# EasyEDA schematic SCH_Christmas-tree-copy_2026-10-15.json
TITLE: Sheet_1; REV: 1.0; Date: 2026-10-11; Sheet: 1/1; Drawn By: masterskaia; Company: Your Company
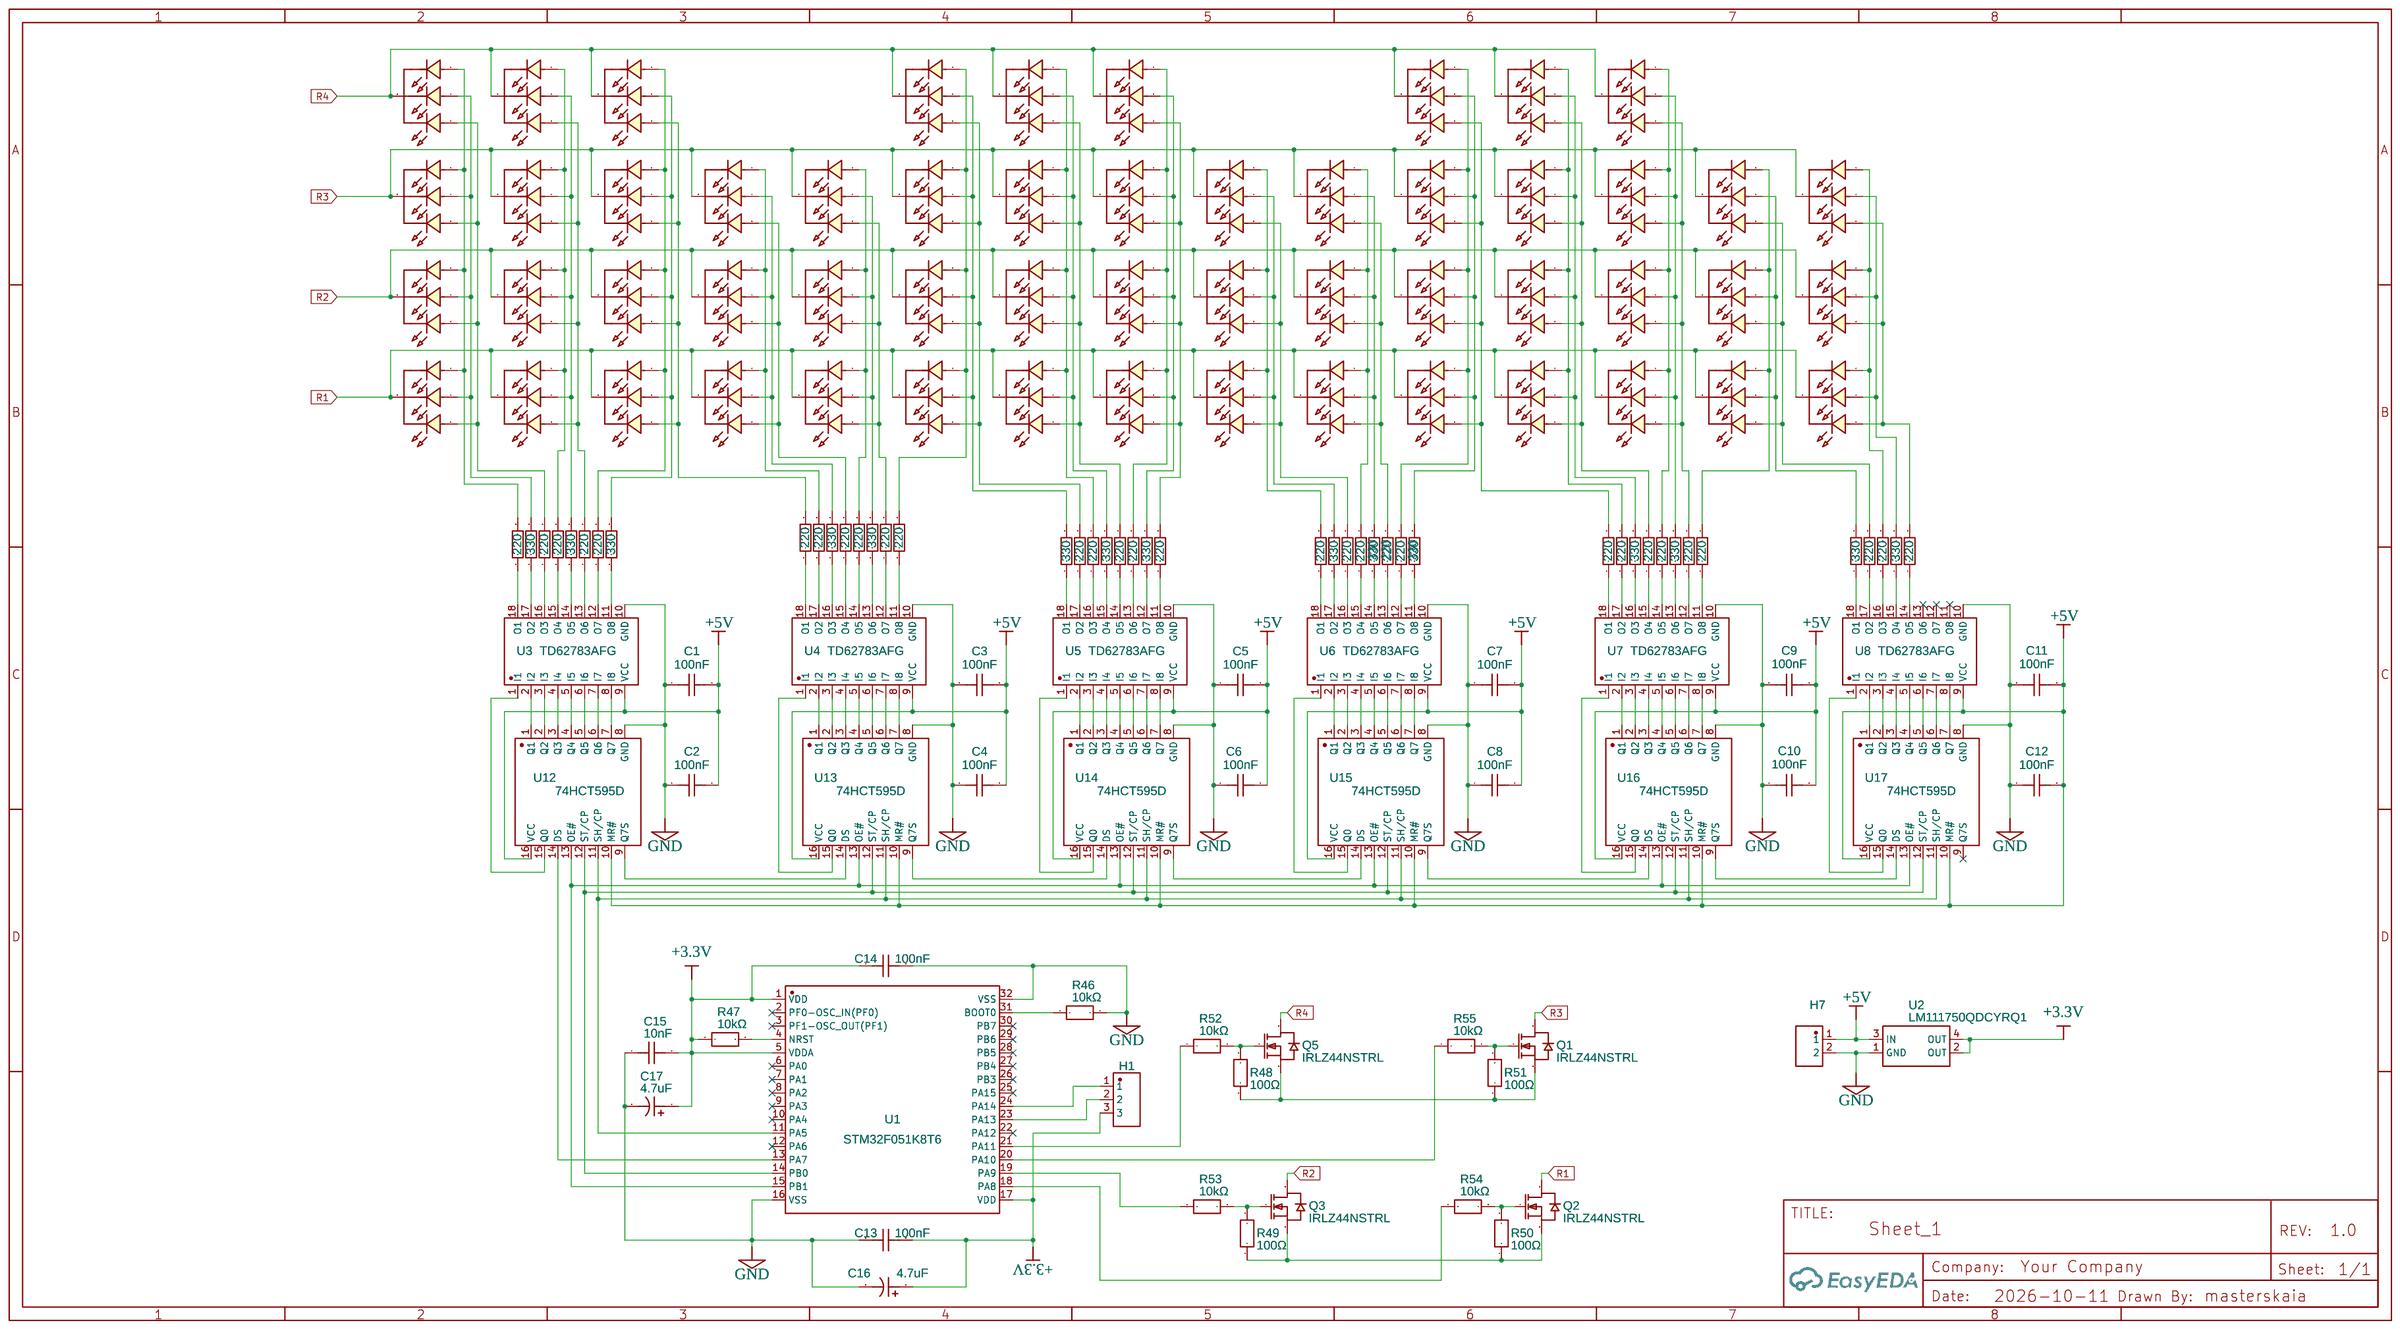
[diagram p0: schematic sheet]

## Parts
C1  100nF  [C0603]
C2  100nF  [C0603]
C3  100nF  [C0603]
C4  100nF  [C0603]
C5  100nF  [C0603]
C6  100nF  [C0603]
C7  100nF  [C0603]
C8  100nF  [C0603]
C9  100nF  [C0603]
C10  100nF  [C0603]
C11  100nF  [C0603]
C12  100nF  [C0603]
C13  100nF  [C0603]
C14  100nF  [C0603]
C15  10nF  [C0603]
C16  4.7uF  [CAP-SMD_L3.2-W1.6]
C17  4.7uF  [CAP-SMD_L3.2-W1.6]
H1  HDGCPH-PZ01-03  [HDR-TH_3P-P2.54-V-M-1]
H7  5AML4-11560-102-W0  [HDR-TH_2P-P2.54-V-M-1]
LED1  R50RGB-4-0045  [LED-TH_4P-L7.6-W7.6-P5.10_R50RGB-4-0045]
LED2  R50RGB-4-0045  [LED-TH_4P-L7.6-W7.6-P5.10_R50RGB-4-0045]
LED3  R50RGB-4-0045  [LED-TH_4P-L7.6-W7.6-P5.10_R50RGB-4-0045]
LED4  R50RGB-4-0045  [LED-TH_4P-L7.6-W7.6-P5.10_R50RGB-4-0045]
LED5  R50RGB-4-0045  [LED-TH_4P-L7.6-W7.6-P5.10_R50RGB-4-0045]
LED6  R50RGB-4-0045  [LED-TH_4P-L7.6-W7.6-P5.10_R50RGB-4-0045]
LED7  R50RGB-4-0045  [LED-TH_4P-L7.6-W7.6-P5.10_R50RGB-4-0045]
LED8  R50RGB-4-0045  [LED-TH_4P-L7.6-W7.6-P5.10_R50RGB-4-0045]
LED9  R50RGB-4-0045  [LED-TH_4P-L7.6-W7.6-P5.10_R50RGB-4-0045]
LED10  R50RGB-4-0045  [LED-TH_4P-L7.6-W7.6-P5.10_R50RGB-4-0045]
LED11  R50RGB-4-0045  [LED-TH_4P-L7.6-W7.6-P5.10_R50RGB-4-0045]
LED12  R50RGB-4-0045  [LED-TH_4P-L7.6-W7.6-P5.10_R50RGB-4-0045]
LED13  R50RGB-4-0045  [LED-TH_4P-L7.6-W7.6-P5.10_R50RGB-4-0045]
LED14  R50RGB-4-0045  [LED-TH_4P-L7.6-W7.6-P5.10_R50RGB-4-0045]
LED15  R50RGB-4-0045  [LED-TH_4P-L7.6-W7.6-P5.10_R50RGB-4-0045]
LED16  R50RGB-4-0045  [LED-TH_4P-L7.6-W7.6-P5.10_R50RGB-4-0045]
LED17  R50RGB-4-0045  [LED-TH_4P-L7.6-W7.6-P5.10_R50RGB-4-0045]
LED18  R50RGB-4-0045  [LED-TH_4P-L7.6-W7.6-P5.10_R50RGB-4-0045]
LED19  R50RGB-4-0045  [LED-TH_4P-L7.6-W7.6-P5.10_R50RGB-4-0045]
LED20  R50RGB-4-0045  [LED-TH_4P-L7.6-W7.6-P5.10_R50RGB-4-0045]
LED21  R50RGB-4-0045  [LED-TH_4P-L7.6-W7.6-P5.10_R50RGB-4-0045]
LED22  R50RGB-4-0045  [LED-TH_4P-L7.6-W7.6-P5.10_R50RGB-4-0045]
LED23  R50RGB-4-0045  [LED-TH_4P-L7.6-W7.6-P5.10_R50RGB-4-0045]
LED24  R50RGB-4-0045  [LED-TH_4P-L7.6-W7.6-P5.10_R50RGB-4-0045]
LED25  R50RGB-4-0045  [LED-TH_4P-L7.6-W7.6-P5.10_R50RGB-4-0045]
LED26  R50RGB-4-0045  [LED-TH_4P-L7.6-W7.6-P5.10_R50RGB-4-0045]
LED27  R50RGB-4-0045  [LED-TH_4P-L7.6-W7.6-P5.10_R50RGB-4-0045]
LED28  R50RGB-4-0045  [LED-TH_4P-L7.6-W7.6-P5.10_R50RGB-4-0045]
LED29  R50RGB-4-0045  [LED-TH_4P-L7.6-W7.6-P5.10_R50RGB-4-0045]
LED30  R50RGB-4-0045  [LED-TH_4P-L7.6-W7.6-P5.10_R50RGB-4-0045]
LED31  R50RGB-4-0045  [LED-TH_4P-L7.6-W7.6-P5.10_R50RGB-4-0045]
LED32  R50RGB-4-0045  [LED-TH_4P-L7.6-W7.6-P5.10_R50RGB-4-0045]
LED33  R50RGB-4-0045  [LED-TH_4P-L7.6-W7.6-P5.10_R50RGB-4-0045]
LED34  R50RGB-4-0045  [LED-TH_4P-L7.6-W7.6-P5.10_R50RGB-4-0045]
LED35  R50RGB-4-0045  [LED-TH_4P-L7.6-W7.6-P5.10_R50RGB-4-0045]
LED36  R50RGB-4-0045  [LED-TH_4P-L7.6-W7.6-P5.10_R50RGB-4-0045]
LED37  R50RGB-4-0045  [LED-TH_4P-L7.6-W7.6-P5.10_R50RGB-4-0045]
LED38  R50RGB-4-0045  [LED-TH_4P-L7.6-W7.6-P5.10_R50RGB-4-0045]
LED39  R50RGB-4-0045  [LED-TH_4P-L7.6-W7.6-P5.10_R50RGB-4-0045]
LED40  R50RGB-4-0045  [LED-TH_4P-L7.6-W7.6-P5.10_R50RGB-4-0045]
LED41  R50RGB-4-0045  [LED-TH_4P-L7.6-W7.6-P5.10_R50RGB-4-0045]
LED42  R50RGB-4-0045  [LED-TH_4P-L7.6-W7.6-P5.10_R50RGB-4-0045]
LED43  R50RGB-4-0045  [LED-TH_4P-L7.6-W7.6-P5.10_R50RGB-4-0045]
LED44  R50RGB-4-0045  [LED-TH_4P-L7.6-W7.6-P5.10_R50RGB-4-0045]
LED45  R50RGB-4-0045  [LED-TH_4P-L7.6-W7.6-P5.10_R50RGB-4-0045]
LED46  R50RGB-4-0045  [LED-TH_4P-L7.6-W7.6-P5.10_R50RGB-4-0045]
LED47  R50RGB-4-0045  [LED-TH_4P-L7.6-W7.6-P5.10_R50RGB-4-0045]
LED48  R50RGB-4-0045  [LED-TH_4P-L7.6-W7.6-P5.10_R50RGB-4-0045]
LED49  R50RGB-4-0045  [LED-TH_4P-L7.6-W7.6-P5.10_R50RGB-4-0045]
LED50  R50RGB-4-0045  [LED-TH_4P-L7.6-W7.6-P5.10_R50RGB-4-0045]
LED51  R50RGB-4-0045  [LED-TH_4P-L7.6-W7.6-P5.10_R50RGB-4-0045]
LED52  R50RGB-4-0045  [LED-TH_4P-L7.6-W7.6-P5.10_R50RGB-4-0045]
LED53  R50RGB-4-0045  [LED-TH_4P-L7.6-W7.6-P5.10_R50RGB-4-0045]
LED54  R50RGB-4-0045  [LED-TH_4P-L7.6-W7.6-P5.10_R50RGB-4-0045]
Q1  IRLZ44NSTRL  [TO-263-2_L10.1-W9.1-P5.08-LS15.2-BR]
Q2  IRLZ44NSTRL  [TO-263-2_L10.1-W9.1-P5.08-LS15.2-BR]
Q3  IRLZ44NSTRL  [TO-263-2_L10.1-W9.1-P5.08-LS15.2-BR]
Q5  IRLZ44NSTRL  [TO-263-2_L10.1-W9.1-P5.08-LS15.2-BR]
R1  330  [R0603]
R2  220  [R0603]
R3  220  [R0603]
R4  220  [R0603]
R5  330  [R0603]
R6  220  [R0603]
R7  220  [R0603]
R8  330  [R0603]
R9  220  [R0603]
R10  220  [R0603]
R11  330  [R0603]
R12  330  [R0603]
R13  220  [R0603]
R14  220  [R0603]
R15  220  [R0603]
R16  220  [R0603]
R17  220  [R0603]
R18  220  [R0603]
R19  330  [R0603]
R20  220  [R0603]
R21  220  [R0603]
R22  330  [R0603]
R23  220  [R0603]
R24  220  [R0603]
R25  330  [R0603]
R26  330  [R0603]
R27  220  [R0603]
R28  220  [R0603]
R29  330  [R0603]
R30  220  [R0603]
R31  220  [R0603]
R32  330  [R0603]
R33  220  [R0603]
R34  220  [R0603]
R35  220  [R0603]
R36  220  [R0603]
R37  330  [R0603]
R38  330  [R0603]
R39  220  [R0603]
R40  220  [R0603]
R41  330  [R0603]
R42  220  [R0603]
R43  220  [R0603]
R44  330  [R0603]
R45  220  [R0603]
R46  10kΩ  [R0603]
R47  10kΩ  [R0603]
R48  100Ω  [R0603]
R49  100Ω  [R0603]
R50  100Ω  [R0603]
R51  100Ω  [R0603]
R52  10kΩ  [R0603]
R53  10kΩ  [R0603]
R54  10kΩ  [R0603]
R55  10kΩ  [R0603]
U1  STM32F051K8T6  [LQFP-32_L7.0-W7.0-P0.80-LS9.0-BL]
U2  LM111750QDCYRQ1  [SOT-223-3_L6.4-W3.5-P2.30-LS7.0-BR]
U3  TD62783AFG  [SOIC-18_L11.6-W7.5-P1.27-LS10.3-BL]
U4  TD62783AFG  [SOIC-18_L11.6-W7.5-P1.27-LS10.3-BL]
U5  TD62783AFG  [SOIC-18_L11.6-W7.5-P1.27-LS10.3-BL]
U6  TD62783AFG  [SOIC-18_L11.6-W7.5-P1.27-LS10.3-BL]
U7  TD62783AFG  [SOIC-18_L11.6-W7.5-P1.27-LS10.3-BL]
U8  TD62783AFG  [SOIC-18_L11.6-W7.5-P1.27-LS10.3-BL]
U12  74HCT595D  [SOIC-16_L10.8-W4.5-P1.27-LS6.8-BL]
U13  74HCT595D  [SOIC-16_L10.8-W4.5-P1.27-LS6.8-BL]
U14  74HCT595D  [SOIC-16_L10.8-W4.5-P1.27-LS6.8-BL]
U15  74HCT595D  [SOIC-16_L10.8-W4.5-P1.27-LS6.8-BL]
U16  74HCT595D  [SOIC-16_L10.8-W4.5-P1.27-LS6.8-BL]
U17  74HCT595D  [SOIC-16_L10.8-W4.5-P1.27-LS6.8-BL]

## Library data of the parts
C1-C12 = 885012206120: Supplier: LCSC; Supplier Part: C7046268; Manufacturer: Wurth(伍尔特); JLCPCB Part Class: Extended Part; Contributor: lcsc
C13 C14 = CC0603X5R100V104KN: Supplier: LCSC; Supplier Part: C54916792; Manufacturer: TORCH(火炬); Contributor: lcsc; JLCPCB Part Class: Extended Part
C15 = CL10B103KC85PNC: Supplier: LCSC; Supplier Part: C16194325; Manufacturer: SAMSUNG(三星); JLCPCB Part Class: Extended Part; Contributor: lcsc
C16 C17 = 293D475X9016A2TE3: Supplier: LCSC; Supplier Part: C2925136; Manufacturer: VISHAY(威世); JLCPCB Part Class: Extended Part; Contributor: lcsc
H1 = HDGCPH-PZ01-03: Supplier: LCSC; Supplier Part: C19190969; Manufacturer: HDGC(华德共创); Contributor: lcsc; JLCPCB Part Class: Extended Part
H7 = 5AML4-11560-102-W0: Supplier: LCSC; Supplier Part: C29780898; Manufacturer: SAMZO(三佐); JLCPCB Part Class: Extended Part; Contributor: lcsc
LED1-LED54 = R50RGB-4-0045: Supplier: LCSC; Supplier Part: C6163964; Manufacturer: BIVAR; JLCPCB Part Class: Extended Part; Contributor: lcsc
Q1-Q3 Q5 = IRLZ44NSTRL(UMW): Supplier: LCSC; Supplier Part: C42370422; Manufacturer: UMW(友台半导体); Contributor: lcsc; JLCPCB Part Class: Extended Part
R1-R45 = RS-03K2200FT: Contributor: LCSC; Supplier: LCSC; Supplier Part: C304718; Manufacturer: FH(风华); JLCPCB Part Class: Extended Part
R46 R47 = APC0603B10K0N: Supplier: LCSC; Supplier Part: C6501163; Manufacturer: Ohmite; Contributor: lcsc; JLCPCB Part Class: Extended Part
R48-R51 = ERJ-H3EF1000V: Supplier: LCSC; Supplier Part: C6190957; Manufacturer: PANASONIC(松下); JLCPCB Part Class: Extended Part; Contributor: lcsc
R52-R55 = CR0603-16W-1002FT: Supplier: LCSC; Supplier Part: C3912456; Manufacturer: Venkel; JLCPCB Part Class: Extended Part; Contributor: lcsc
U1 = STM32F051K8T6: Contributor: LCSC; Supplier: LCSC; Supplier Part: C465973; Manufacturer: ST(意法半导体); JLCPCB Part Class: Extended Part
U2 = LM111750QDCYRQ1: Supplier: LCSC; Supplier Part: C54284395; Manufacturer: TI(德州仪器); Contributor: lcsc; JLCPCB Part Class: Extended Part
U3-U8 = TD62783AFG(O,S,EL): Supplier: LCSC; Supplier Part: C5331579; Manufacturer: TOSHIBA(东芝); Contributor: lcsc; JLCPCB Part Class: Extended Part
U12-U17 = 74HCT595D,112: Contributor: LCSC; Supplier: LCSC; Manufacturer: Nexperia(安世); Supplier Part: C70468; JLCPCB Part Class: Extended Part

## Nets
+3.3V: C13.2 C14.1 C15.2 C16.1 C17.1 H1.3 R47.1 U1.1(VDD) U1.5(VDDA) U1.17(VDD) U2.2(OUT) U2.4(OUT)
+5V: C1.2 C2.2 C3.2 C4.2 C5.2 C6.2 C7.2 C8.2 C9.1 C10.2 C11.2 C12.2 H7.1 U2.3(IN) U3.9(VCC) U4.9(VCC) U5.9(VCC) U6.9(VCC) U7.9(VCC) U8.9(VCC) U12.10(MR#) U12.16(VCC) U13.10(MR#) U13.16(VCC) U14.10(MR#) U14.16(VCC) U15.10(MR#) U15.16(VCC) U16.10(MR#) U16.16(VCC) U17.10(MR#) U17.16(VCC)
GND: C1.1 C2.1 C3.1 C4.1 C5.1 C6.1 C7.1 C8.1 C9.2 C10.1 C11.1 C12.1 C13.1 C14.2 C15.1 C16.2 C17.2 H7.2 R46.2 U1.16(VSS) U1.32(VSS) U2.1(GND) U3.10(GND) U4.10(GND) U5.10(GND) U6.10(GND) U7.10(GND) U8.10(GND) U12.8(GND) U13.8(GND) U14.8(GND) U15.8(GND) U16.8(GND) U17.8(GND)
R1: LED40.2(A) LED41.2(A) LED42.2(A) LED43.2(A) LED44.2(A) LED45.2(A) LED46.2(A) LED47.2(A) LED48.2(A) LED49.2(A) LED50.2(A) LED51.2(A) LED52.2(A) LED53.2(A) LED54.2(A) Q2.2(D)
R2: LED22.2(A) LED23.2(A) LED24.2(A) LED25.2(A) LED26.2(A) LED27.2(A) LED28.2(A) LED29.2(A) LED30.2(A) LED31.2(A) LED32.2(A) LED33.2(A) LED34.2(A) LED35.2(A) LED36.2(A) Q3.2(D)
R3: LED1.2(A) LED2.2(A) LED3.2(A) LED4.2(A) LED5.2(A) LED6.2(A) LED7.2(A) LED8.2(A) LED9.2(A) LED10.2(A) LED11.2(A) LED12.2(A) LED13.2(A) LED14.2(A) LED15.2(A) Q1.2(D)
R4: LED16.2(A) LED17.2(A) LED18.2(A) LED19.2(A) LED20.2(A) LED21.2(A) LED37.2(A) LED38.2(A) LED39.2(A) Q5.2(D)
Net-(H1-1): H1.1 U1.24(PA14)
Net-(H1-2): H1.2 U1.23(PA13)
Net-(LED1-1): LED1.1(K) LED17.1(K) LED36.1(K) LED54.1(K) R3.2
Net-(LED1-3): LED1.3(K) LED17.3(K) LED36.3(K) LED54.3(K) R2.2
Net-(LED1-4): LED1.4(K) LED17.4(K) LED36.4(K) LED54.4(K) R1.2
Net-(LED2-1): LED2.1(K) LED16.1(K) LED35.1(K) LED53.1(K) R4.2
Net-(LED2-3): LED2.3(K) LED16.3(K) LED35.3(K) LED53.3(K) R6.2
Net-(LED2-4): LED2.4(K) LED16.4(K) LED35.4(K) LED53.4(K) R5.2
Net-(LED3-1): LED3.1(K) LED34.1(K) LED52.1(K) R10.2
Net-(LED3-3): LED3.3(K) LED34.3(K) LED52.3(K) R14.2
Net-(LED3-4): LED3.4(K) LED34.4(K) LED52.4(K) R11.2
Net-(LED4-1): LED4.1(K) LED18.1(K) LED33.1(K) LED51.1(K) R7.2
Net-(LED4-3): LED4.3(K) LED18.3(K) LED33.3(K) LED51.3(K) R9.2
Net-(LED4-4): LED4.4(K) LED18.4(K) LED33.4(K) LED51.4(K) R8.2
Net-(LED5-1): LED5.1(K) LED32.1(K) LED50.1(K) R13.2
Net-(LED5-3): LED5.3(K) LED32.3(K) LED50.3(K) R16.2
Net-(LED5-4): LED5.4(K) LED32.4(K) LED50.4(K) R12.2
Net-(LED6-1): LED6.1(K) LED31.1(K) LED49.1(K) R28.2
Net-(LED6-3): LED6.3(K) LED31.3(K) LED49.3(K) R30.2
Net-(LED6-4): LED6.4(K) LED31.4(K) LED49.4(K) R29.2
Net-(LED7-1): LED7.1(K) LED19.1(K) LED30.1(K) LED48.1(K) R21.2
Net-(LED7-3): LED7.3(K) LED19.3(K) LED30.3(K) LED48.3(K) R23.2
Net-(LED7-4): LED7.4(K) LED19.4(K) LED30.4(K) LED48.4(K) R25.2
Net-(LED8-1): LED8.1(K) LED29.1(K) LED47.1(K) R24.2
Net-(LED8-3): LED8.3(K) LED29.3(K) LED47.3(K) R27.2
Net-(LED8-4): LED8.4(K) LED29.4(K) LED47.4(K) R26.2
Net-(LED9-1): LED9.1(K) LED21.1(K) LED28.1(K) LED46.1(K) R18.2
Net-(LED9-3): LED9.3(K) LED21.3(K) LED28.3(K) LED46.3(K) R20.2
Net-(LED9-4): LED9.4(K) LED21.4(K) LED28.4(K) LED46.4(K) R22.2
Net-(LED10-1): LED10.1(K) LED20.1(K) LED27.1(K) LED45.1(K) R15.2
Net-(LED10-3): LED10.3(K) LED20.3(K) LED27.3(K) LED45.3(K) R17.2
Net-(LED10-4): LED10.4(K) LED20.4(K) LED27.4(K) LED45.4(K) R19.2
Net-(LED11-1): LED11.1(K) LED26.1(K) LED44.1(K) R43.2
Net-(LED11-3): LED11.3(K) LED26.3(K) LED44.3(K) R45.2
Net-(LED11-4): LED11.4(K) LED26.4(K) LED44.4(K) R44.2
Net-(LED12-1): LED12.1(K) LED25.1(K) LED37.1(K) LED43.1(K) R36.2
Net-(LED12-3): LED12.3(K) LED25.3(K) LED37.3(K) LED43.3(K) R33.2
Net-(LED12-4): LED12.4(K) LED25.4(K) LED37.4(K) LED43.4(K) R37.2
Net-(LED13-1): LED13.1(K) LED24.1(K) LED42.1(K) R34.2
Net-(LED13-3): LED13.3(K) LED24.3(K) LED42.3(K) R42.2
Net-(LED13-4): LED13.4(K) LED24.4(K) LED42.4(K) R41.2
Net-(LED14-1): LED14.1(K) LED23.1(K) LED39.1(K) LED41.1(K) R39.2
Net-(LED14-3): LED14.3(K) LED23.3(K) LED39.3(K) LED41.3(K) R35.2
Net-(LED14-4): LED14.4(K) LED23.4(K) LED39.4(K) LED41.4(K) R38.2
Net-(LED15-1): LED15.1(K) LED22.1(K) LED38.1(K) LED40.1(K) R31.2
Net-(LED15-3): LED15.3(K) LED22.3(K) LED38.3(K) LED40.3(K) R40.2
Net-(LED15-4): LED15.4(K) LED22.4(K) LED38.4(K) LED40.4(K) R32.2
Net-(Q1-1): Q1.1(G) R51.2 R55.2
Net-(Q1-3): Q1.3(S) Q5.3(S) R48.2 R51.1
Net-(Q2-1): Q2.1(G) R50.2 R54.2
Net-(Q2-3): Q2.3(S) Q3.3(S) R49.1 R50.1
Net-(Q3-1): Q3.1(G) R49.2 R53.2
Net-(Q5-1): Q5.1(G) R48.1 R52.2
Net-(R1-1): R1.1 U3.17(O2)
Net-(R2-1): R2.1 U3.16(O3)
Net-(R3-1): R3.1 U3.18(O1)
Net-(R4-1): R4.1 U3.15(O4)
Net-(R5-1): R5.1 U3.14(O5)
Net-(R6-1): R6.1 U3.13(O6)
Net-(R7-1): R7.1 U3.12(O7)
Net-(R8-1): R8.1 U3.11(O8)
Net-(R9-1): R9.1 U4.18(O1)
Net-(R10-1): R10.1 U4.17(O2)
Net-(R11-1): R11.1 U4.16(O3)
Net-(R12-1): R12.1 U4.13(O6)
Net-(R13-1): R13.1 U4.14(O5)
Net-(R14-1): R14.1 U4.15(O4)
Net-(R15-1): R15.1 U4.11(O8)
Net-(R16-1): R16.1 U4.12(O7)
Net-(R17-1): R17.1 U5.17(O2)
Net-(R18-1): R18.1 U5.16(O3)
Net-(R19-1): R19.1 U5.18(O1)
Net-(R20-1): R20.1 U5.14(O5)
Net-(R21-1): R21.1 U5.13(O6)
Net-(R22-1): R22.1 U5.15(O4)
Net-(R23-1): R23.1 U5.11(O8)
Net-(R24-1): R24.1 U6.18(O1)
Net-(R25-1): R25.1 U5.12(O7)
Net-(R26-1): R26.1 U6.17(O2)
Net-(R27-1): R27.1 U6.16(O3)
Net-(R28-1): R28.1 U6.15(O4)
Net-(R29-1): R29.1 U6.14(O5)
Net-(R30-1): R30.1 U6.13(O6)
Net-(R31-1): R31.1 U6.12(O7)
Net-(R32-1): R32.1 U6.11(O8)
Net-(R33-1): R33.1 U7.12(O7)
Net-(R34-1): R34.1 U7.11(O8)
Net-(R35-1): R35.1 U7.15(O4)
Net-(R36-1): R36.1 U7.14(O5)
Net-(R37-1): R37.1 U7.13(O6)
Net-(R38-1): R38.1 U7.16(O3)
Net-(R39-1): R39.1 U7.17(O2)
Net-(R40-1): R40.1 U7.18(O1)
Net-(R41-1): R41.1 U8.18(O1)
Net-(R42-1): R42.1 U8.17(O2)
Net-(R43-1): R43.1 U8.16(O3)
Net-(R44-1): R44.1 U8.15(O4)
Net-(R45-1): R45.1 U8.14(O5)
Net-(R46-1): R46.1 U1.31(BOOT0)
Net-(R47-2): R47.2 U1.4(NRST)
Net-(R52-1): R52.1 U1.21(PA11)
Net-(R53-1): R53.1 U1.19(PA9)
Net-(R54-1): R54.1 U1.18(PA8)
Net-(R55-1): R55.1 U1.20(PA10)
Net-(U1-11): U1.11(PA5) U12.11(SH/CP) U13.11(SH/CP) U14.11(SH/CP) U15.11(SH/CP) U16.11(SH/CP) U17.11(SH/CP)
Net-(U1-13): U1.13(PA7) U12.14(DS)
Net-(U1-14): U1.14(PB0) U12.12(ST/CP) U13.12(ST/CP) U14.12(ST/CP) U15.12(ST/CP) U16.12(ST/CP) U17.12(ST/CP)
Net-(U1-15): U1.15(PB1) U12.13(OE#) U13.13(OE#) U14.13(OE#) U15.13(OE#) U16.13(OE#) U17.13(OE#)
Net-(U3-1): U3.1(I1) U12.15(Q0)
Net-(U3-2): U3.2(I2) U12.1(Q1)
Net-(U3-3): U3.3(I3) U12.2(Q2)
Net-(U3-4): U3.4(I4) U12.3(Q3)
Net-(U3-5): U3.5(I5) U12.4(Q4)
Net-(U3-6): U3.6(I6) U12.5(Q5)
Net-(U3-7): U3.7(I7) U12.6(Q6)
Net-(U3-8): U3.8(I8) U12.7(Q7)
Net-(U4-1): U4.1(I1) U13.15(Q0)
Net-(U4-2): U4.2(I2) U13.1(Q1)
Net-(U4-3): U4.3(I3) U13.2(Q2)
Net-(U4-4): U4.4(I4) U13.3(Q3)
Net-(U4-5): U4.5(I5) U13.4(Q4)
Net-(U4-6): U4.6(I6) U13.5(Q5)
Net-(U4-7): U4.7(I7) U13.6(Q6)
Net-(U4-8): U4.8(I8) U13.7(Q7)
Net-(U5-1): U5.1(I1) U14.15(Q0)
Net-(U5-2): U5.2(I2) U14.1(Q1)
Net-(U5-3): U5.3(I3) U14.2(Q2)
Net-(U5-4): U5.4(I4) U14.3(Q3)
Net-(U5-5): U5.5(I5) U14.4(Q4)
Net-(U5-6): U5.6(I6) U14.5(Q5)
Net-(U5-7): U5.7(I7) U14.6(Q6)
Net-(U5-8): U5.8(I8) U14.7(Q7)
Net-(U6-1): U6.1(I1) U15.15(Q0)
Net-(U6-2): U6.2(I2) U15.1(Q1)
Net-(U6-3): U6.3(I3) U15.2(Q2)
Net-(U6-4): U6.4(I4) U15.3(Q3)
Net-(U6-5): U6.5(I5) U15.4(Q4)
Net-(U6-6): U6.6(I6) U15.5(Q5)
Net-(U6-7): U6.7(I7) U15.6(Q6)
Net-(U6-8): U6.8(I8) U15.7(Q7)
Net-(U7-1): U7.1(I1) U16.15(Q0)
Net-(U7-2): U7.2(I2) U16.1(Q1)
Net-(U7-3): U7.3(I3) U16.2(Q2)
Net-(U7-4): U7.4(I4) U16.3(Q3)
Net-(U7-5): U7.5(I5) U16.4(Q4)
Net-(U7-6): U7.6(I6) U16.5(Q5)
Net-(U7-7): U7.7(I7) U16.6(Q6)
Net-(U7-8): U7.8(I8) U16.7(Q7)
Net-(U8-1): U8.1(I1) U17.15(Q0)
Net-(U8-2): U8.2(I2) U17.1(Q1)
Net-(U8-3): U8.3(I3) U17.2(Q2)
Net-(U8-4): U8.4(I4) U17.3(Q3)
Net-(U8-5): U8.5(I5) U17.4(Q4)
Net-(U8-6): U8.6(I6) U17.5(Q5)
Net-(U8-7): U8.7(I7) U17.6(Q6)
Net-(U8-8): U8.8(I8) U17.7(Q7)
Net-(U12-9): U12.9(Q7S) U13.14(DS)
Net-(U13-9): U13.9(Q7S) U14.14(DS)
Net-(U14-9): U14.9(Q7S) U15.14(DS)
Net-(U15-9): U15.9(Q7S) U16.14(DS)
Net-(U16-9): U16.9(Q7S) U17.14(DS)

Not connected (* = marked no-connect by the designer): U1 2(PF0-OSC_IN(PF0))* 3(PF1-OSC_OUT(PF1))* 6(PA0)* 7(PA1)* 8(PA2)* 9(PA3)* 10(PA4)* 12(PA6)* 22(PA12)* 25(PA15)* 26(PB3)* 27(PB4)* 28(PB5)* 29(PB6)* 30(PB7)*; U8 11(O8)* 12(O7)* 13(O6)*; U17 9(Q7S)*

## Notes on the sheet
- 330
- 220
- 330
